# Altium schematic sheet MCU.SchDoc: MCU
size Tabloid; Author: Adam Turaj; SheetNumber: 3; SheetTotal: 6
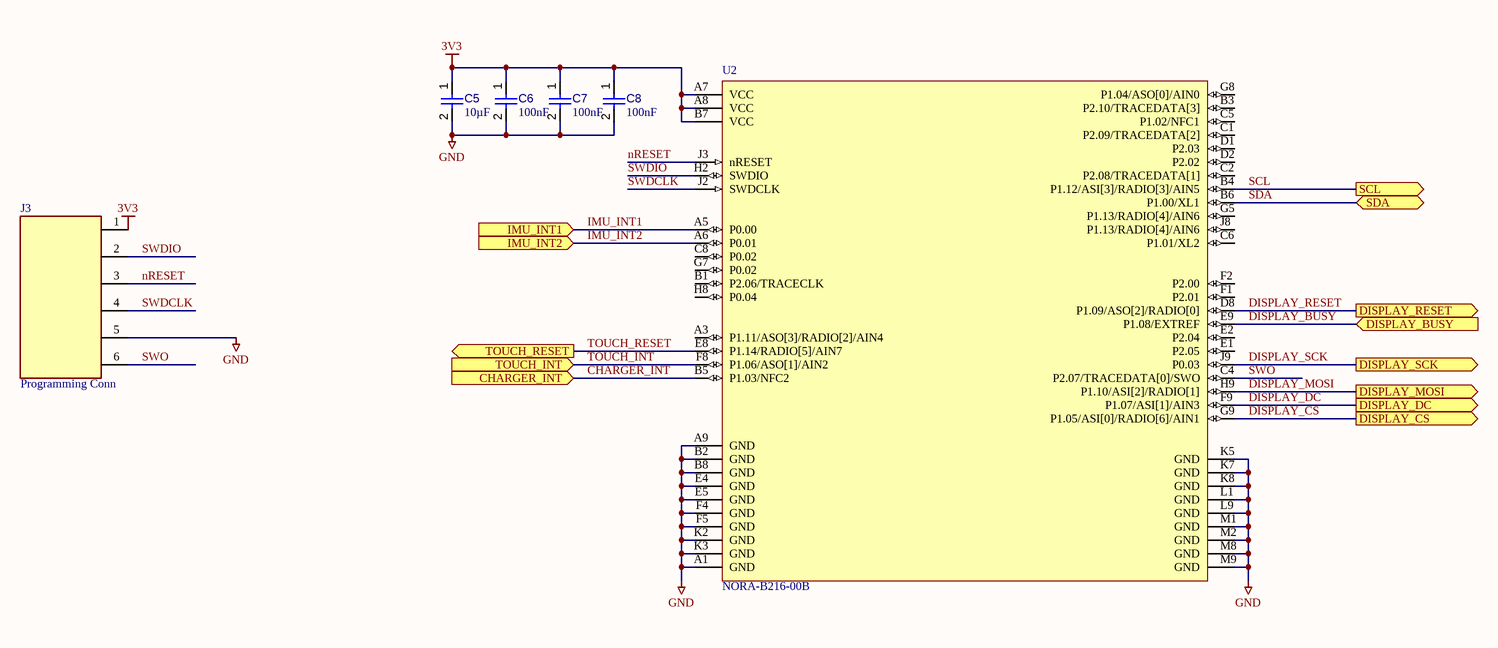
[diagram p0: MCU.SchDoc]

## Parts
C5  value 10µF  [CAPC0603(1608)100_L]  (hidden comment: Capacitor 10µF +/-20% 10V 0603)
C6  value 100nF  [CAPC1608X90X40NL10T20]  (hidden comment: Capacitor 100 nF +/-10% 50 V 0603)
C7  value 100nF  [CAPC1608X90X40NL10T20]  (hidden comment: Capacitor 100 nF +/-10% 50 V 0603)
C8  value 100nF  [CAPC1608X90X40NL10T20]  (hidden comment: Capacitor 100 nF +/-10% 50 V 0603)
J3  Programming Conn  [prog-connector-Footprint-1]
U2  NORA-B216-00B  [NORAB21600B]

## Ports
CHARGER_INT (in, see Root[3C]), DISPLAY_BUSY (in, see Root[3B], Display[3B]), DISPLAY_CS (out, see Root[3B]), DISPLAY_DC (out, see Root[3B]), DISPLAY_MOSI (out, see Root[3B]), DISPLAY_RESET (out, see Root[3B], Display[3B]), DISPLAY_SCK (out, see Root[3B]), IMU_INT1 (in, see Root[3B]), IMU_INT2 (in, see Root[3B]), SCL (out, see Root[3B], Battery_Charger[2C], Display[4B], IMU[4B]), SDA (bidir, see Root[3B], Battery_Charger[2C], Display[4B], IMU[4B]), TOUCH_INT (in, see Root[3C], Display[4B]), TOUCH_RESET (out, see Root[3B], Display[4B])

## Nets
3V3: C5.1 C6.1 C7.1 C8.1 J3.1 U2.A7(VCC) U2.A8(VCC) U2.B7(VCC)
GND: C5.2 C6.2 C7.2 C8.2 J3.5 U2.A1(GND) U2.A9(GND) U2.B2(GND) U2.B8(GND) U2.E4(GND) U2.E5(GND) U2.F4(GND) U2.F5(GND) U2.K2(GND) U2.K3(GND) U2.K5(GND) U2.K7(GND) U2.K8(GND) U2.L1(GND) U2.L9(GND) U2.M1(GND) U2.M2(GND) U2.M8(GND) U2.M9(GND)
CHARGER_INT: U2.B5(P1.03/NFC2) ; port CHARGER_INT
DISPLAY_BUSY: U2.E9(P1.08/EXTREF) ; port DISPLAY_BUSY
DISPLAY_CS: U2.G9(P1.05/ASI[0]/RADIO[6]/AIN1) ; port DISPLAY_CS
DISPLAY_DC: U2.F9(P1.07/ASI[1]/AIN3) ; port DISPLAY_DC
DISPLAY_MOSI: U2.H9(P1.10/ASI[2]/RADIO[1]) ; port DISPLAY_MOSI
DISPLAY_RESET: U2.D8(P1.09/ASO[2]/RADIO[0]) ; port DISPLAY_RESET
DISPLAY_SCK: U2.J9(P0.03) ; port DISPLAY_SCK
IMU_INT1: U2.A5(P0.00) ; port IMU_INT1
IMU_INT2: U2.A6(P0.01) ; port IMU_INT2
nRESET: J3.3 U2.J3(nRESET)
SCL: U2.B4(P1.12/ASI[3]/RADIO[3]/AIN5) ; port SCL
SDA: U2.B6(P1.00/XL1) ; port SDA
SWDCLK: J3.4 U2.J2(SWDCLK)
SWDIO: J3.2 U2.H2(SWDIO)
SWO: J3.6 U2.C4(P2.07/TRACEDATA[0]/SWO)
TOUCH_INT: U2.F8(P1.06/ASO[1]/AIN2) ; port TOUCH_INT
TOUCH_RESET: U2.E8(P1.14/RADIO[5]/AIN7) ; port TOUCH_RESET

Not connected (* = marked no-connect by the designer): U2 A2(NC) A3(P1.11/ASO[3]/RADIO[2]/AIN4) A4(NC) B1(P2.06/TRACECLK) B3(P2.10/TRACEDATA[3]) B9(NC) C1(P2.09/TRACEDATA[2]) C2(P2.08/TRACEDATA[1]) C5(P1.02/NFC1) C6(P1.01/XL2) C8(P0.02) C9(NC) D1(P2.03) D2(P2.02) D3(NC) D7(NC) D9(NC) E1(P2.05) E2(P2.04) E3(NC) E7(NC) F1(P2.01) F2(P2.00) F3(NC) F7(NC) G1(NC) G2(NC) G3(NC) G4(NC) G5(P1.13/RADIO[4]/AIN6) G7(P0.02) G8(P1.04/ASO[0]/AIN0) H1(NC) H3(NC) H7(NC) H8(P0.04) J1(NC) J4(NC) J5(NC) J7(NC) J8(P1.13/RADIO[4]/AIN6) K1(NC) K9(NC)

## Notes on the sheet
- Title:
- Author:
- Size:
- Date:
- Git Hash:
- Tabloid
- Prj:
- Variant:
- Edited:
- File:

## Library data of the parts
C5 = CMP-001-00075-4: Chip Capacitor, 10µF +/-20%, 10V, 0603, Thickness 1 mm; Tolerance: 10%; Voltage Rating: 10V; Max Operating Temperature: 85°C; Pins: 2; Case/Package: 0603; Mounting Technology: SMT; Min Operating Temperature: -55°C
C6-C8 = CMP-001-00017-6: Chip Capacitor, 100 nF, +/- 10%, 50 V, 0603 (1608 Metric); Voltage Rating: 50V; Capacitor Type: Ceramic; Tolerance: 10%; Mounting Technology: SM; Max Operating Temperature: 125°C; RoHS Compliant: True; Pins: 2; Case/Package: 0603; Min Operating Temperature: -55°C
J3 = CMP-002-00075-2: Custom TC2030-NL based connector for programming
U2 = CMP-403-000000-3: Bluetooth Modules - 802.15.1 Bluetooth LE module, (open CPU), pcb antenna, nRF54L10 chip; Manufacturer_Name: u-blox; Geometry.Height: 2mm; Arrow Price/Stock: https://www.arrow.com/en/products/nora-b216-00b/u-blox.html?utm_currency=USD&region=nac; Arrow Part Number: NORA-B216-00B; Manufacturer_Part_Number: NORA-B216-00B; Mouser Price/Stock: *; Design Item ID: NORA-B216-00B; Mouser Part Number: *; Source: NORA-B216-00B.SchLib; Datasheet Link: https://content.u-blox.com/sites/default/files/documents/NORA-B2_DataSheet_UBXDOC-1023859458-38975.pdf